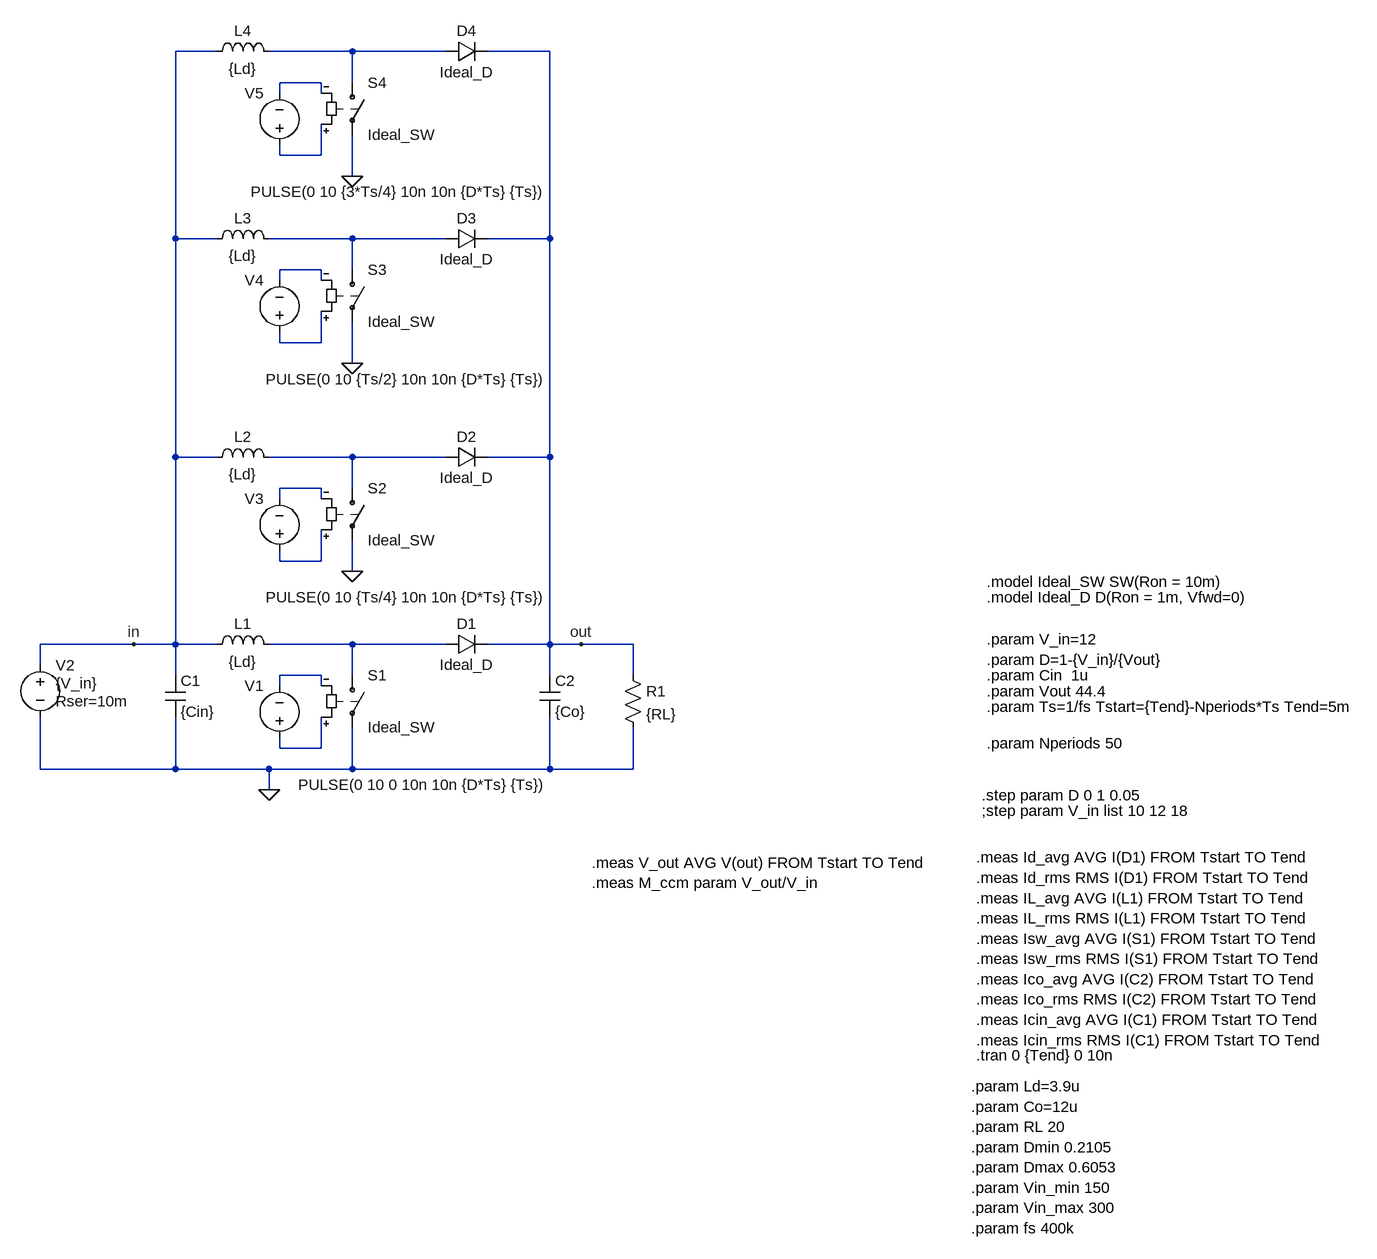
[diagram p0: schematic boostideal_inter4.asc]
boostideal_inter4.asc, the LTspice schematic file:
Version 4.1
SHEET 1 1884 2580
WIRE 64 -800 0 -800
WIRE 272 -800 144 -800
WIRE 416 -800 272 -800
WIRE 576 -800 480 -800
WIRE 224 -752 160 -752
WIRE 272 -752 272 -800
WIRE 160 -736 160 -752
WIRE 224 -736 224 -752
WIRE 160 -640 160 -656
WIRE 224 -640 224 -688
WIRE 224 -640 160 -640
WIRE 272 -608 272 -672
WIRE 0 -512 0 -800
WIRE 64 -512 0 -512
WIRE 272 -512 144 -512
WIRE 416 -512 272 -512
WIRE 576 -512 576 -800
WIRE 576 -512 480 -512
WIRE 224 -464 160 -464
WIRE 272 -464 272 -512
WIRE 160 -448 160 -464
WIRE 224 -448 224 -464
WIRE 160 -352 160 -368
WIRE 224 -352 224 -400
WIRE 224 -352 160 -352
WIRE 272 -320 272 -384
WIRE 0 -176 0 -512
WIRE 64 -176 0 -176
WIRE 272 -176 144 -176
WIRE 416 -176 272 -176
WIRE 576 -176 576 -512
WIRE 576 -176 480 -176
WIRE 224 -128 160 -128
WIRE 272 -128 272 -176
WIRE 160 -112 160 -128
WIRE 224 -112 224 -128
WIRE 160 -16 160 -32
WIRE 224 -16 224 -64
WIRE 224 -16 160 -16
WIRE 272 0 272 -48
WIRE -64 112 -208 112
WIRE 0 112 0 -176
WIRE 0 112 -64 112
WIRE 64 112 0 112
WIRE 272 112 144 112
WIRE 416 112 272 112
WIRE 576 112 576 -176
WIRE 576 112 480 112
WIRE 624 112 576 112
WIRE 704 112 624 112
WIRE -208 144 -208 112
WIRE 0 160 0 112
WIRE 224 160 160 160
WIRE 272 160 272 112
WIRE 576 160 576 112
WIRE 704 160 704 112
WIRE 160 176 160 160
WIRE 224 176 224 160
WIRE 160 272 160 256
WIRE 224 272 224 224
WIRE 224 272 160 272
WIRE -208 304 -208 224
WIRE 0 304 0 224
WIRE 0 304 -208 304
WIRE 144 304 0 304
WIRE 272 304 272 240
WIRE 272 304 144 304
WIRE 576 304 576 224
WIRE 576 304 272 304
WIRE 704 304 704 240
WIRE 704 304 576 304
WIRE 144 336 144 304
FLAG 144 336 0
FLAG 624 112 out
FLAG -64 112 in
FLAG 272 0 0
FLAG 272 -320 0
FLAG 272 -608 0
SYMBOL cap -16 160 R0
SYMATTR InstName C1
SYMATTR Value {Cin}
SYMATTR SpiceLine Rser=10m
SYMBOL cap 560 160 R0
SYMATTR InstName C2
SYMATTR Value {Co}
SYMATTR SpiceLine Rser=200m
SYMBOL res 688 144 R0
SYMATTR InstName R1
SYMATTR Value {RL}
SYMBOL ind 48 128 R270
WINDOW 0 32 56 VTop 2
WINDOW 3 5 56 VBottom 2
SYMATTR InstName L1
SYMATTR Value {Ld}
SYMBOL sw 272 144 R0
SYMATTR InstName S1
SYMATTR Value Ideal_SW
SYMBOL diode 416 128 R270
WINDOW 0 32 32 VTop 2
WINDOW 3 0 32 VBottom 2
SYMATTR InstName D1
SYMATTR Value Ideal_D
SYMBOL voltage 160 272 R180
WINDOW 0 24 96 Left 2
WINDOW 3 -412 -56 Left 2
WINDOW 123 0 0 Left 0
WINDOW 39 0 0 Left 0
SYMATTR InstName V1
SYMATTR Value PULSE(0 10 0 10n 10n {D*Ts} {Ts})
SYMBOL voltage -208 128 R0
WINDOW 3 24 44 Left 2
WINDOW 123 0 0 Left 0
WINDOW 39 24 72 Left 2
SYMATTR Value {V_in}
SYMATTR SpiceLine Rser=10m
SYMATTR InstName V2
SYMBOL ind 48 -160 R270
WINDOW 0 32 56 VTop 2
WINDOW 3 5 56 VBottom 2
SYMATTR InstName L2
SYMATTR Value {Ld}
SYMBOL sw 272 -144 R0
SYMATTR InstName S2
SYMATTR Value Ideal_SW
SYMBOL diode 416 -160 R270
WINDOW 0 32 32 VTop 2
WINDOW 3 0 32 VBottom 2
SYMATTR InstName D2
SYMATTR Value Ideal_D
SYMBOL voltage 160 -16 R180
WINDOW 0 24 96 Left 2
WINDOW 3 -412 -56 Left 2
WINDOW 123 0 0 Left 0
WINDOW 39 0 0 Left 0
SYMATTR InstName V3
SYMATTR Value PULSE(0 10 {Ts/4} 10n 10n {D*Ts} {Ts})
SYMBOL ind 48 -496 R270
WINDOW 0 32 56 VTop 2
WINDOW 3 5 56 VBottom 2
SYMATTR InstName L3
SYMATTR Value {Ld}
SYMBOL sw 272 -480 R0
SYMATTR InstName S3
SYMATTR Value Ideal_SW
SYMBOL diode 416 -496 R270
WINDOW 0 32 32 VTop 2
WINDOW 3 0 32 VBottom 2
SYMATTR InstName D3
SYMATTR Value Ideal_D
SYMBOL voltage 160 -352 R180
WINDOW 0 24 96 Left 2
WINDOW 3 -412 -56 Left 2
WINDOW 123 0 0 Left 0
WINDOW 39 0 0 Left 0
SYMATTR InstName V4
SYMATTR Value PULSE(0 10 {Ts/2} 10n 10n {D*Ts} {Ts})
SYMBOL ind 48 -784 R270
WINDOW 0 32 56 VTop 2
WINDOW 3 5 56 VBottom 2
SYMATTR InstName L4
SYMATTR Value {Ld}
SYMBOL sw 272 -768 R0
SYMATTR InstName S4
SYMATTR Value Ideal_SW
SYMBOL diode 416 -784 R270
WINDOW 0 32 32 VTop 2
WINDOW 3 0 32 VBottom 2
SYMATTR InstName D4
SYMATTR Value Ideal_D
SYMBOL voltage 160 -640 R180
WINDOW 0 24 96 Left 2
WINDOW 3 -412 -56 Left 2
WINDOW 123 0 0 Left 0
WINDOW 39 0 0 Left 0
SYMATTR InstName V5
SYMATTR Value PULSE(0 10 {3*Ts/4} 10n 10n {D*Ts} {Ts})
TEXT 1224 792 Left 2 !.param Ld=3.9u\n.param Co=12u\n.param RL 20\n.param Dmin 0.2105\n.param Dmax 0.6053\n.param Vin_min 150\n.param Vin_max 300\n.param fs 400k
TEXT 1232 744 Left 2 !.tran 0 {Tend} 0 10n
TEXT 1248 104 Left 2 !.param V_in=12
TEXT 1248 136 Left 2 !.param D=1-{V_in}/{Vout}
TEXT 1248 160 Left 2 !.param Cin  1u
TEXT 1248 208 Left 2 !.param Ts=1/fs Tstart={Tend}-Nperiods*Ts Tend=5m
TEXT 1248 16 Left 2 !.model Ideal_SW SW(Ron = 10m)
TEXT 1248 40 Left 2 !.model Ideal_D D(Ron = 1m, Vfwd=0)
TEXT 1232 440 Left 2 !.meas Id_avg AVG I(D1) FROM Tstart TO Tend\n.meas Id_rms RMS I(D1) FROM Tstart TO Tend\n.meas IL_avg AVG I(L1) FROM Tstart TO Tend\n.meas IL_rms RMS I(L1) FROM Tstart TO Tend\n.meas Isw_avg AVG I(S1) FROM Tstart TO Tend\n.meas Isw_rms RMS I(S1) FROM Tstart TO Tend\n.meas Ico_avg AVG I(C2) FROM Tstart TO Tend\n.meas Ico_rms RMS I(C2) FROM Tstart TO Tend\n.meas Icin_avg AVG I(C1) FROM Tstart TO Tend\n.meas Icin_rms RMS I(C1) FROM Tstart TO Tend
TEXT 1240 368 Left 2 !;step param V_in list 10 12 18
TEXT 1248 184 Left 2 !.param Vout 44.4
TEXT 1248 264 Left 2 !.param Nperiods 50
TEXT 1240 344 Left 2 !.step param D 0 1 0.05
TEXT 640 448 Left 2 !.meas V_out AVG V(out) FROM Tstart TO Tend\n.meas M_ccm param V_out/V_in

The netlist it stands for:
* boostideal_inter4.asc
C1 in 0 {Cin} Rser=10m
C2 out 0 {Co} Rser=200m
R1 out 0 {RL}
L1 in N010 {Ld}
S1 N010 0 N012 N011 Ideal_SW
D1 N010 out Ideal_D
V1 N012 N011 PULSE(0 10 0 10n 10n {D*Ts} {Ts})
V2 in 0 {V_in} Rser=10m
L2 in N007 {Ld}
S2 N007 0 N009 N008 Ideal_SW
D2 N007 out Ideal_D
V3 N009 N008 PULSE(0 10 {Ts/4} 10n 10n {D*Ts} {Ts})
L3 in N004 {Ld}
S3 N004 0 N006 N005 Ideal_SW
D3 N004 out Ideal_D
V4 N006 N005 PULSE(0 10 {Ts/2} 10n 10n {D*Ts} {Ts})
L4 in N001 {Ld}
S4 N001 0 N003 N002 Ideal_SW
D4 N001 out Ideal_D
V5 N003 N002 PULSE(0 10 {3*Ts/4} 10n 10n {D*Ts} {Ts})
.model D D
.lib standard.dio
.param Ld=3.9u
.param Co=12u
.param RL 20
.param Dmin 0.2105
.param Dmax 0.6053
.param Vin_min 150
.param Vin_max 300
.param fs 400k
.tran 0 {Tend} 0 10n
.param V_in=12
.param D=1-{V_in}/{Vout}
.param Cin  1u
.param Ts=1/fs Tstart={Tend}-Nperiods*Ts Tend=5m
.model Ideal_SW SW(Ron = 10m)
.model Ideal_D D(Ron = 1m, Vfwd=0)
.meas Id_avg AVG I(D1) FROM Tstart TO Tend
.meas Id_rms RMS I(D1) FROM Tstart TO Tend
.meas IL_avg AVG I(L1) FROM Tstart TO Tend
.meas IL_rms RMS I(L1) FROM Tstart TO Tend
.meas Isw_avg AVG I(S1) FROM Tstart TO Tend
.meas Isw_rms RMS I(S1) FROM Tstart TO Tend
.meas Ico_avg AVG I(C2) FROM Tstart TO Tend
.meas Ico_rms RMS I(C2) FROM Tstart TO Tend
.meas Icin_avg AVG I(C1) FROM Tstart TO Tend
.meas Icin_rms RMS I(C1) FROM Tstart TO Tend
;step param V_in list 10 12 18
.param Vout 44.4
.param Nperiods 50
.step param D 0 1 0.05
.meas V_out AVG V(out) FROM Tstart TO Tend
.meas M_ccm param V_out/V_in
.backanno
.end